# Altium project DIO_8SMA_8MCX.PrjPCB (part 3 of 4)

## Sheet DIOT_SMA_BASE_Split.schdoc: =DocumentName
size A3; EDA_Number: DIOT; Projet: KASLI 3U subsystem; ModifiedBy: -; CreateDate: XX/XX/XXXX; CheckedDate: -; Title2: v1.0; DivGrp: ISE; Designer: A.B.; DocumentNumber: 1; Revision: 0; SheetNumber: 15; SheetTotal: 17
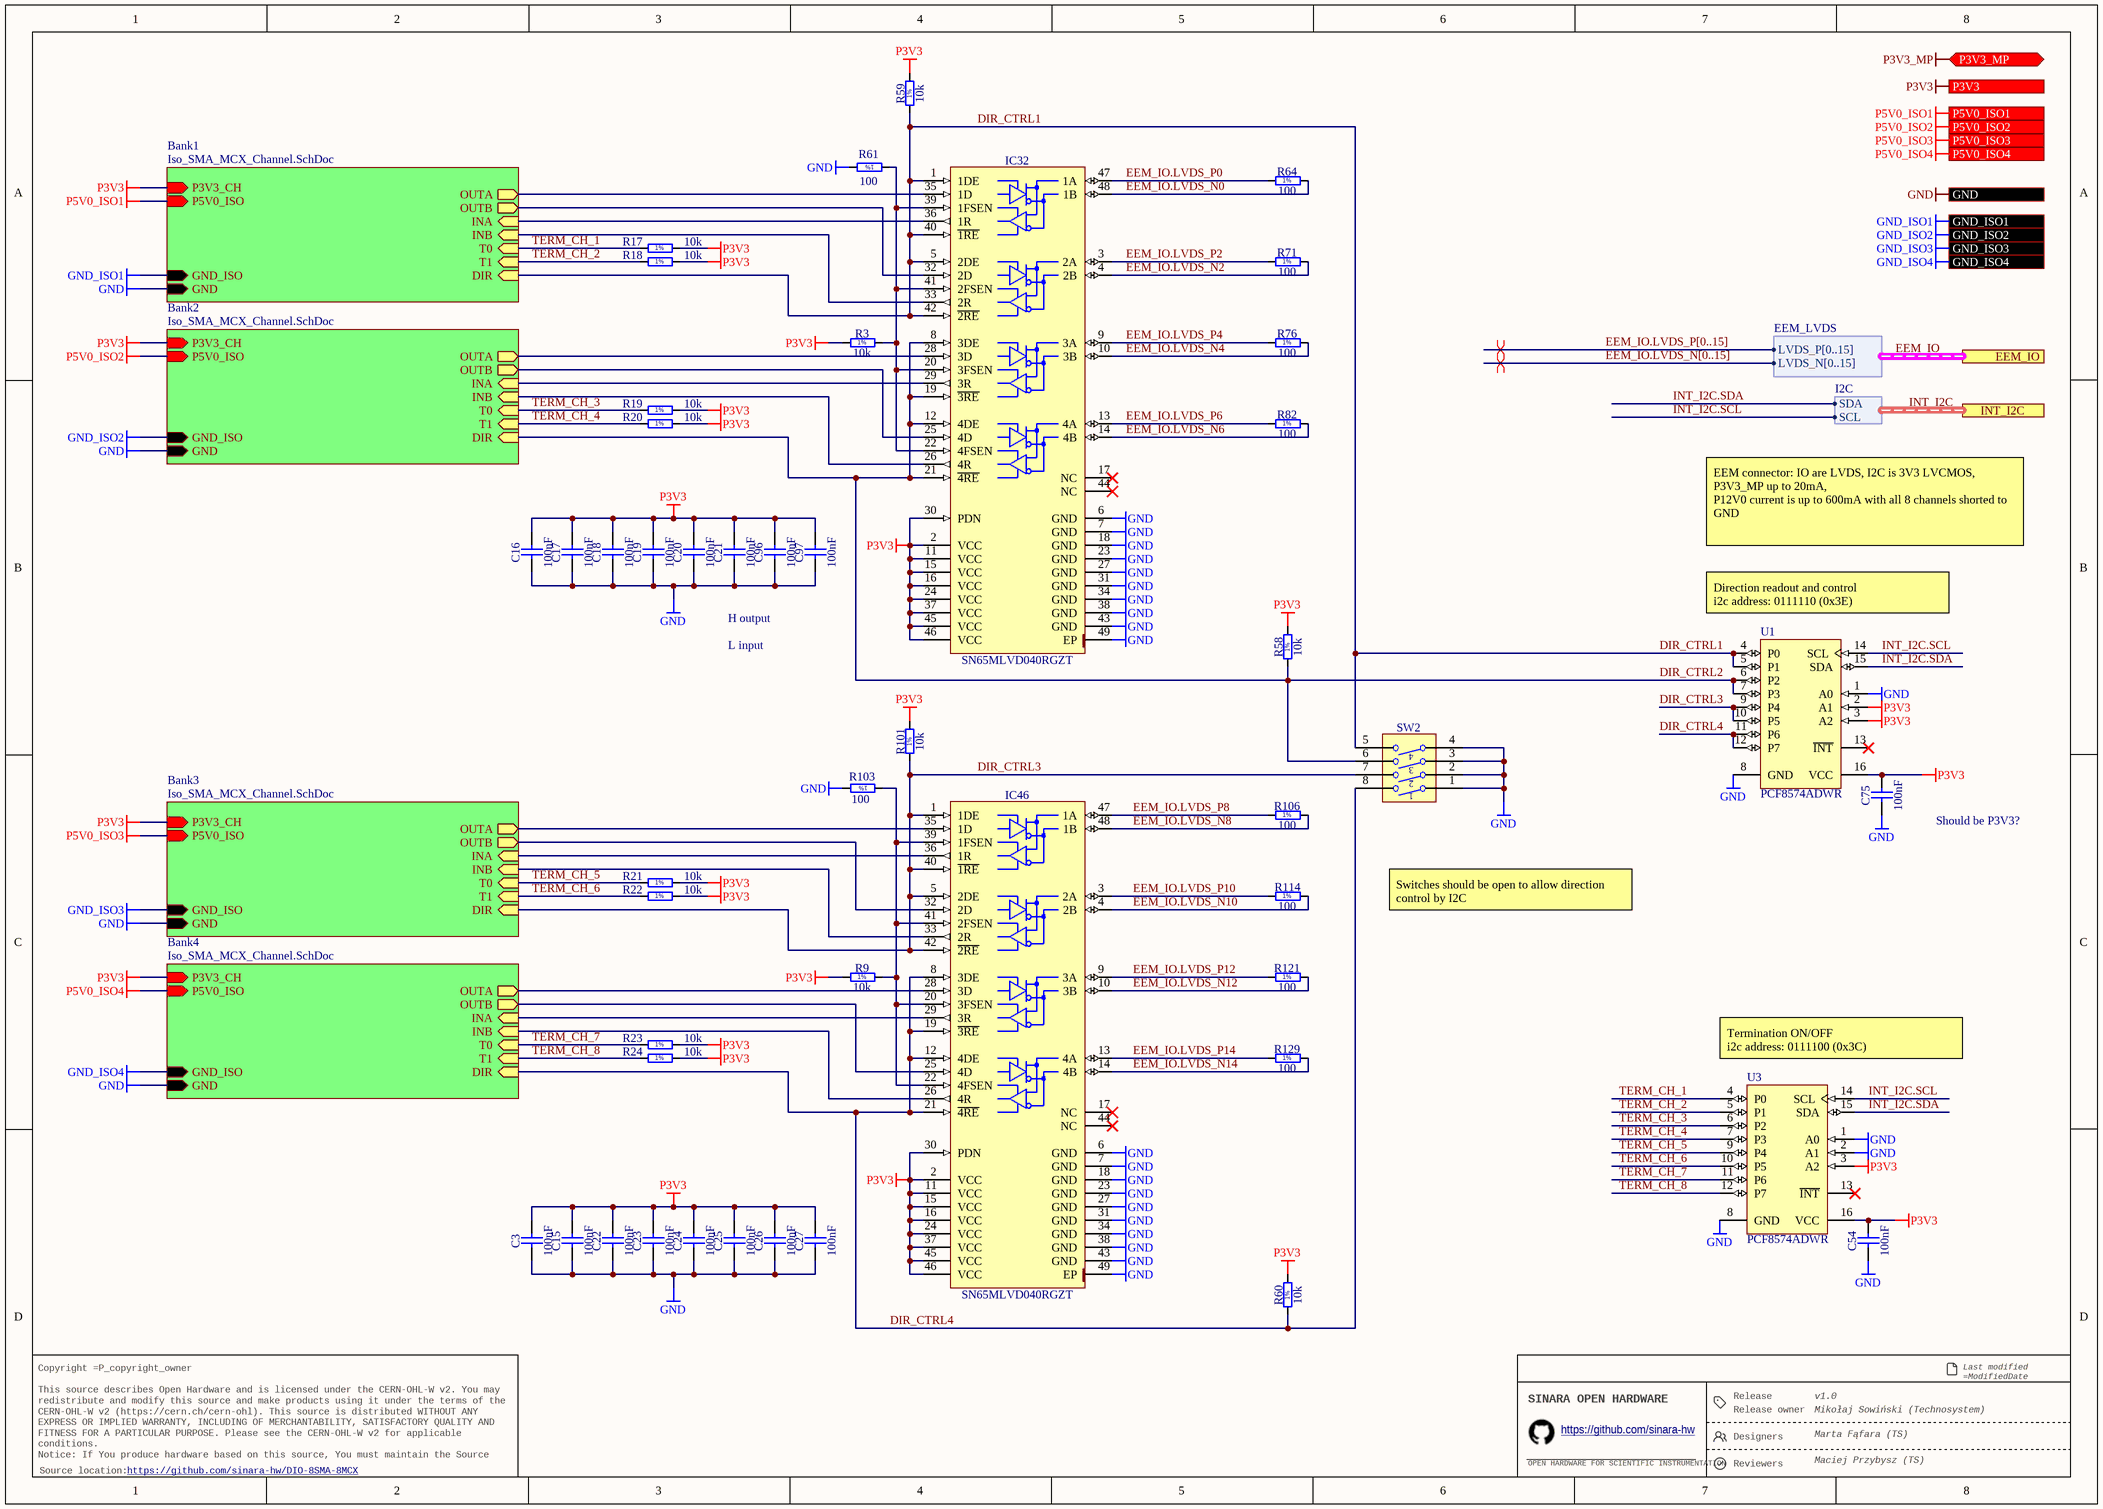
[diagram p14: DIOT_SMA_BASE_Split.schdoc]

### Parts
C3  100nF  [CAPC1005X55N]
C15  100nF  [CAPC1005X55N]
C16  100nF  [CAPC1005X55N]
C17  100nF  [CAPC1005X55N]
C18  100nF  [CAPC1005X55N]
C19  100nF  [CAPC1005X55N]
C20  100nF  [CAPC1005X55N]
C21  100nF  [CAPC1005X55N]
C22  100nF  [CAPC1005X55N]
C23  100nF  [CAPC1005X55N]
C24  100nF  [CAPC1005X55N]
C25  100nF  [CAPC1005X55N]
C26  100nF  [CAPC1005X55N]
C27  100nF  [CAPC1005X55N]
C54  100nF  [CAPC1005X55N]
C75  100nF  [CAPC1005X55N]
C96  100nF  [CAPC1005X55N]
C97  100nF  [CAPC1005X55N]
IC32  SN65MLVD040RGZT  [QFN50P700X700X100-49N-S420]
IC46  SN65MLVD040RGZT  [QFN50P700X700X100-49N-S420]
R3  10k  [RESC1005X40N]
R9  10k  [RESC1005X40N]
R17  10k  [RESC1005X40N]
R18  10k  [RESC1005X40N]
R19  10k  [RESC1005X40N]
R20  10k  [RESC1005X40N]
R21  10k  [RESC1005X40N]
R22  10k  [RESC1005X40N]
R23  10k  [RESC1005X40N]
R24  10k  [RESC1005X40N]
R58  10k  [RESC1005X40N]
R59  10k  [RESC1005X40N]
R60  10k  [RESC1005X40N]
R61  100  [RESC1005X40N]
R64  100  [RESC1005X40N]
R71  100  [RESC1005X40N]
R76  100  [RESC1005X40N]
R82  100  [RESC1005X40N]
R101  10k  [RESC1005X40N]
R103  100  [RESC1005X40N]
R106  100  [RESC1005X40N]
R114  100  [RESC1005X40N]
R121  100  [RESC1005X40N]
R129  100  [RESC1005X40N]
SW2  Switch  [SW_OMRON_A6S-4102-H]  (value not drawn)
U1  PCF8574ADWR  [DW0016A_M]
U3  PCF8574ADWR  [DW0016A_M]

### Sub-sheets
Bank1 = Iso_SMA_MCX_Channel.SchDoc: OUTA (out), OUTB (out), INA (in), INB (in), DIR (in), P3V3_CH (in), P5V0_ISO (in), GND_ISO (in), GND (in), T1 (in), T0 (in)
Bank2 = Iso_SMA_MCX_Channel.SchDoc: OUTA (out), OUTB (out), INA (in), INB (in), DIR (in), P3V3_CH (in), P5V0_ISO (in), GND_ISO (in), GND (in), T1 (in), T0 (in)
Bank3 = Iso_SMA_MCX_Channel.SchDoc: OUTA (out), OUTB (out), INA (in), INB (in), DIR (in), P3V3_CH (in), P5V0_ISO (in), GND_ISO (in), GND (in), T0 (in), T1 (in)
Bank4 = Iso_SMA_MCX_Channel.SchDoc: OUTA (out), OUTB (out), INA (in), INB (in), DIR (in), P3V3_CH (in), P5V0_ISO (in), GND_ISO (in), GND (in), T1 (in), T0 (in)

### Ports
EEM_IO (harness EEM_LVDS), GND, GND_ISO1, GND_ISO2, GND_ISO3, GND_ISO4, INT_I2C (harness I2C), P3V3 (out), P3V3_MP (bidir), P5V0_ISO1 (out), P5V0_ISO2 (out), P5V0_ISO3 (out), P5V0_ISO4 (out)

### Harnesses
I2C: SDA, SCL
EEM_LVDS: LVDS_P[0..15], LVDS_N[0..15]

### Nets
GND: C3.1 C15.1 C16.1 C17.1 C18.1 C19.1 C20.1 C21.1 C22.1 C23.1 C24.1 C25.1 C26.1 C27.1 C54.1 C75.1 C96.1 C97.1 IC32.6(GND) IC32.7(GND) IC32.18(GND) IC32.23(GND) IC32.27(GND) IC32.31(GND) IC32.34(GND) IC32.38(GND) IC32.43(GND) IC32.49(EP) IC46.6(GND) IC46.7(GND) IC46.18(GND) IC46.23(GND) IC46.27(GND) IC46.31(GND) IC46.34(GND) IC46.38(GND) IC46.43(GND) IC46.49(EP) R61.2 R103.2 SW2.1 SW2.2 SW2.3 SW2.4 U1.1(A0) U1.8(GND) U3.1(A0) U3.2(A1) U3.8(GND) ; port GND, sheet Bank1/GND, sheet Bank2/GND, sheet Bank3/GND, sheet Bank4/GND
GND_ISO1: port GND_ISO1, sheet Bank1/GND_ISO
GND_ISO2: port GND_ISO2, sheet Bank2/GND_ISO
GND_ISO3: port GND_ISO3, sheet Bank3/GND_ISO
GND_ISO4: port GND_ISO4, sheet Bank4/GND_ISO
P3V3: C3.2 C15.2 C16.2 C17.2 C18.2 C19.2 C20.2 C21.2 C22.2 C23.2 C24.2 C25.2 C26.2 C27.2 C54.2 C75.2 C96.2 C97.2 IC32.2(VCC) IC32.11(VCC) IC32.15(VCC) IC32.16(VCC) IC32.24(VCC) IC32.30(PDN) IC32.37(VCC) IC32.45(VCC) IC32.46(VCC) IC46.2(VCC) IC46.11(VCC) IC46.15(VCC) IC46.16(VCC) IC46.24(VCC) IC46.30(PDN) IC46.37(VCC) IC46.45(VCC) IC46.46(VCC) R3.1 R9.1 R17.2 R18.2 R19.2 R20.2 R21.2 R22.2 R23.2 R24.2 R58.2 R59.2 R60.2 R101.2 U1.2(A1) U1.3(A2) U1.16(VCC) U3.3(A2) U3.16(VCC) ; port P3V3, sheet Bank1/P3V3_CH, sheet Bank2/P3V3_CH, sheet Bank3/P3V3_CH, sheet Bank4/P3V3_CH
P5V0_ISO1: port P5V0_ISO1, sheet Bank1/P5V0_ISO
P5V0_ISO2: port P5V0_ISO2, sheet Bank2/P5V0_ISO
P5V0_ISO3: port P5V0_ISO3, sheet Bank3/P5V0_ISO
P5V0_ISO4: port P5V0_ISO4, sheet Bank4/P5V0_ISO
DIR_CTRL1: IC32.1(1DE) IC32.5(2DE) IC32.40(~{1RE}) IC32.42(~{2RE}) R59.1 SW2.5 U1.4(P0) U1.5(P1) ; sheet Bank1/DIR
DIR_CTRL2: IC32.8(3DE) IC32.12(4DE) IC32.19(~{3RE}) IC32.21(~{4RE}) R58.1 SW2.6 U1.6(P2) U1.7(P3) ; sheet Bank2/DIR
DIR_CTRL3: IC46.1(1DE) IC46.5(2DE) IC46.40(~{1RE}) IC46.42(~{2RE}) R101.1 SW2.7 U1.9(P4) U1.10(P5) ; sheet Bank3/DIR
DIR_CTRL4: IC46.8(3DE) IC46.12(4DE) IC46.19(~{3RE}) IC46.21(~{4RE}) R60.1 SW2.8 U1.11(P6) U1.12(P7) ; sheet Bank4/DIR
EEM_IO.LVDS_N0: IC32.48(1B) R64.2
EEM_IO.LVDS_N2: IC32.4(2B) R71.2
EEM_IO.LVDS_N4: IC32.10(3B) R76.2
EEM_IO.LVDS_N6: IC32.14(4B) R82.2
EEM_IO.LVDS_N8: IC46.48(1B) R106.2
EEM_IO.LVDS_N10: IC46.4(2B) R114.2
EEM_IO.LVDS_N12: IC46.10(3B) R121.2
EEM_IO.LVDS_N14: IC46.14(4B) R129.2
EEM_IO.LVDS_P0: IC32.47(1A) R64.1
EEM_IO.LVDS_P2: IC32.3(2A) R71.1
EEM_IO.LVDS_P4: IC32.9(3A) R76.1
EEM_IO.LVDS_P6: IC32.13(4A) R82.1
EEM_IO.LVDS_P8: IC46.47(1A) R106.1
EEM_IO.LVDS_P10: IC46.3(2A) R114.1
EEM_IO.LVDS_P12: IC46.9(3A) R121.1
EEM_IO.LVDS_P14: IC46.13(4A) R129.1
INT_I2C.SCL: U1.14(SCL) U3.14(SCL) ; port INT_I2C.SCL  [project net I2C_A.SCL]
INT_I2C.SDA: U1.15(SDA) U3.15(SDA) ; port INT_I2C.SDA  [project net I2C_A.SDA]
TERM_CH_1: R17.1 U3.4(P0) ; sheet Bank1/T0
TERM_CH_2: R18.1 U3.5(P1) ; sheet Bank1/T1
TERM_CH_3: R19.1 U3.6(P2) ; sheet Bank2/T0
TERM_CH_4: R20.1 U3.7(P3) ; sheet Bank2/T1
TERM_CH_5: R21.1 U3.9(P4) ; sheet Bank3/T0
TERM_CH_6: R22.1 U3.10(P5) ; sheet Bank3/T1
TERM_CH_7: R23.1 U3.11(P6) ; sheet Bank4/T0
TERM_CH_8: R24.1 U3.12(P7) ; sheet Bank4/T1
NetB5A_1: IC32.35(1D) ; sheet Bank1/OUTA
NetB5B_1: IC32.28(3D) ; sheet Bank2/OUTA
NetB5C_1: IC46.35(1D) ; sheet Bank3/OUTA
NetB5D_1: IC46.28(3D) ; sheet Bank4/OUTA
NetB7A_1: IC32.32(2D) ; sheet Bank1/OUTB
NetB7B_1: IC32.25(4D) ; sheet Bank2/OUTB
NetB7C_1: IC46.32(2D) ; sheet Bank3/OUTB
NetB7D_1: IC46.25(4D) ; sheet Bank4/OUTB
NetB8A_1: IC32.36(1R) ; sheet Bank1/INA
NetB8B_1: IC32.29(3R) ; sheet Bank2/INA
NetB8C_1: IC46.36(1R) ; sheet Bank3/INA
NetB8D_1: IC46.29(3R) ; sheet Bank4/INA
NetB9A_1: IC32.33(2R) ; sheet Bank1/INB
NetB9B_1: IC32.26(4R) ; sheet Bank2/INB
NetB9C_1: IC46.33(2R) ; sheet Bank3/INB
NetB9D_1: IC46.26(4R) ; sheet Bank4/INB
NetIC32_20: IC32.20(3FSEN) IC32.22(4FSEN) IC32.39(1FSEN) IC32.41(2FSEN) R3.2 R61.1
NetIC46_20: IC46.20(3FSEN) IC46.22(4FSEN) IC46.39(1FSEN) IC46.41(2FSEN) R9.2 R103.1

Not connected (* = marked no-connect by the designer): IC32 17(NC)* 44(NC)*; IC46 17(NC)* 44(NC)*; U1 13(~{INT})*; U3 13(~{INT})*

### Buses and harness runs
bus EEM_IO.LVDS_N[0..15]
bus EEM_IO.LVDS_P[0..15]
harness EEM_IO = port EEM_IO
harness INT_I2C = port INT_I2C

### Layout directives
differential pair; differential pair class Diff_100Ohm: (no net found under the mark)

### Notes on the sheet
- EEM connector: IO are LVDS, I2C is 3V3 LVCMOS, P3V3_MP up to 20mA,
  P12V0 current is up to 600mA with all 8 channels shorted to GND
- H output
- L input
- (near U1) Direction readout and control
  i2c address: 0111110 (0x3E)
- Should be P3V3?
- Switches should be open to allow direction control by I2C
- (near U3) Termination ON/OFF
  i2c address: 0111100 (0x3C)
- Release
- Last modified =ModifiedDate
  Sheet =sheetnumber of =sheettotal · Size A3
- Copyright =P_copyright_owner
  This source describes Open Hardware and is licensed under the CERN-OHL-W v2. You may redistribute and modify this source and make products using it under the terms of the CERN-OHL-W v2 (https://cern.ch/cern-ohl). This source is distributed WITHOUT ANY EXPRESS OR IMPLIED WARRANTY, INCLUDING OF MERCHANTABILITY, SATISFACTORY QUALITY AND FITNESS FOR A PARTICULAR PURPOSE. Please see the CERN-OHL-W v2 for applicable conditions.
  Notice: If You produce hardware based on this source, You must maintain the Source Location visible on the product, its packaging or its documentation.
- SINARA OPEN HARDWARE
- OPEN HARDWARE FOR SCIENTIFIC INSTRUMENTATION
- https://github.com/sinara-hw
- Release owner
- Designers
- Reviewers
- Source location:
- (in symbol R0402_10K_1%_0.0625W_100PPM) 1%
- (in symbol R0402_100R_1%_0.1W_100PPM) 1%

### Library data of the parts
C3 C15-C27 C54 C75 C96 C97 = CC0402_100NF_50V_10%_X7R: Non-polarised capacitor; Part Description: SMD Multilayer Chip Ceramic Capacitor; Manufacturer: GENERIC; Manufacturer1 Part Number: GRM155R71H104KE14D; Voltage: 50V; TC: X7R; Tolerance: ±10%; Part Number: CC0402_100NF_50V_10%_X7R; Component Kind: Standard; Component Type: Standard; Pin Count: 2; Value: 100nF; Status: None; Manufacturer Part Number: CC0402_100NF_50V_10%_X7R; Case: 0402; Mounted: Yes; Socket: No; SMD: Yes; Sense: No; HelpURL: \\cern.ch\dfs\Applications\Altium\Datasheets\CC0402_MURATA_GRM155R71H104KE14D.pdf; Author: CERN DEM MR; CreateDate: 30.06.2017; LatestRevisionDate: 30.06.2017; Manufacturer1 Example: MURATA; Manufacturer1 ComponentHeight: 0.55mm
IC32 IC46 = SN65MLVD040RGZT: 4-Channel Half-Duplex M-LVDS Line Transceiver; Manufacturer: TEXAS INSTRUMENTS; PressFit: No; Bonding: No; Part Number: SN65MLVD040RGZT; Component Kind: Standard; Component Type: Standard; Device: SN65MLVD040RGZT; PackageDescription: QFN, 0.50mm Pitch, Square; 48 Pin, 7.00mm L X 7.00mm W X 1mm H body (W/Thermal Tab 4.2mm X 4.2mm), IPC Medium Density; Part Description: 4-Channel Half-Duplex M-LVDS Line Transceiver; Manufacturer Part Number: SN65MLVD040RGZT; Pin Count: 49; Case: QFN48; Mounted: Yes; Socket: No; SMD: Yes; Sense: No; ComponentHeight: 1mm; Author: CERN DEM JLC; HelpURL: \\cern.ch\dfs\Applications\Altium\Datasheets\SN65MLVD040RGZT.pdf; CreateDate: 17.03.2011; LatestRevisionDate: 17.03.2011
R3 R9 R17-R24 R58-R60 R101 = R0402_10K_1%_0.0625W_100PPM: Resistor - 1%; Part Description: General Purpose Thick Film Chip Resistor; Manufacturer: GENERIC; Manufacturer1 Part Number: 232270671003L; TC: ±100ppm/°C; Part Number: R0402_10K_1%_0.0625W_100PPM; Component Kind: Standard; Component Type: Standard; Pin Count: 2; Value: 10k; Status: Not recommended; Power: 0.0625W; Tolerance: ±1%; Manufacturer Part Number: R0402_10K_1%_0.0625W_100PPM; Case: 0402; Mounted: Yes; Sense: No; Socket: No; SMD: Yes; Manufacturer1 Example: YAGEO PHYCOMP; Manufacturer1 ComponentHeight: 0.4mm; HelpURL: \\cern.ch\dfs\Applications\Altium\Datasheets\R0402_Phycomp_RC0402.pdf; Author: CERN DEM JLC; CreateDate: 03.12.2007; LatestRevisionDate: 17.10.2012
R61 R64 R71 R76 R82 R103 R106 R114 R121 R129 = R0402_100R_1%_0.1W_100PPM: Resistor - 1%; Part Description: General Purpose Thick Film Chip Resistor; Manufacturer: GENERIC; Manufacturer Part Number: R0402_100R_1%_0.1W_100PPM_50V; Manufacturer1 Part Number: ERJ2RKF1000X; Power: 0.1W; TC: ±100ppm/°C; Voltage: 50V; Part Number: R0402_100R_1%_0.1W_100PPM; Component Kind: Standard; Component Type: Standard; Pin Count: 2; Value: 100; Status: Not recommended; Tolerance: ±1%; Case: 0402; Mounted: Yes; Sense: No; Socket: No; SMD: Yes; Manufacturer1 Example: PANASONIC; Manufacturer1 ComponentHeight: 0.4mm; HelpURL: \\cern.ch\dfs\Applications\Altium\Datasheets\R0402_PANASONIC_ERJ2RK.pdf; Author: CERN DEM JLC; CreateDate: 12.12.2013; LatestRevisionDate: 03.03.2015
SW2 = SW_OMRON_A6S-4102-H: 4 Ways SPST DIP Switch; Part Description: 4 Ways SPST DIP Switch, White Flat Actuator with Seal Tape, Contact Rating 25mA 24VDC; Manufacturer: OMRON; PressFit: No; Part Number: SW_OMRON_A6S-4102-H; Component Kind: Standard; Component Type: Standard; Pin Count: 8; PackageDescription: Pitch 2.54mm, Body 11.3x6.4mm, 4 Ways SPST Surface-Mounting DIP Switch, OMRON A6S-H; Family: Switch; Mounted: Yes; Socket: No; SMD: Yes; Sense: No; Status: None; Manufacturer Part Number: A6S-4102-H; ComponentHeight: 3.8mm; HelpURL: \\cern.ch\dfs\Applications\Altium\Datasheets\SW_OMRON_A6S-4102-H.pdf; Author: CERN DEM JMW; CreateDate: 25.09.2008; LatestRevisionDate: 25.09.2008
U1 U3 = CMP-015-00013-1: 8-bit 2.5- to 5.5-V I2C/SMBus I/O expander with interrupt 16-SOIC -40 to 85; Manufacturer: Texas Instruments; Max Supply Voltage: 6V; Min Supply Voltage: 2.5V; Case/Package: SOIC; Manufacturer Part Number: PCF8574ADWR; Pins: 16; Min Operating Temperature: -40°C; Max Operating Temperature: 85°C

## Sheet Iso_SMA_MCX_Channel.SchDoc: =DocumentName
size A4; Organization: Technosystem; Address1: Słoneczna 125, 05-506 Kolonia Lesznowola; Address2: https://technosystem.pl/; Address4: (NOT USED); DocumentNumber: 8; Revision: 0; SheetNumber: 16; SheetTotal: 17; Version: 1.0
Used 4 times, as channels U_DIOT_SMA_BASE/Bank1, U_DIOT_SMA_BASE/Bank2, U_DIOT_SMA_BASE/Bank3, U_DIOT_SMA_BASE/Bank4. Parts and nets are listed once, with the designators drawn on the sheet.
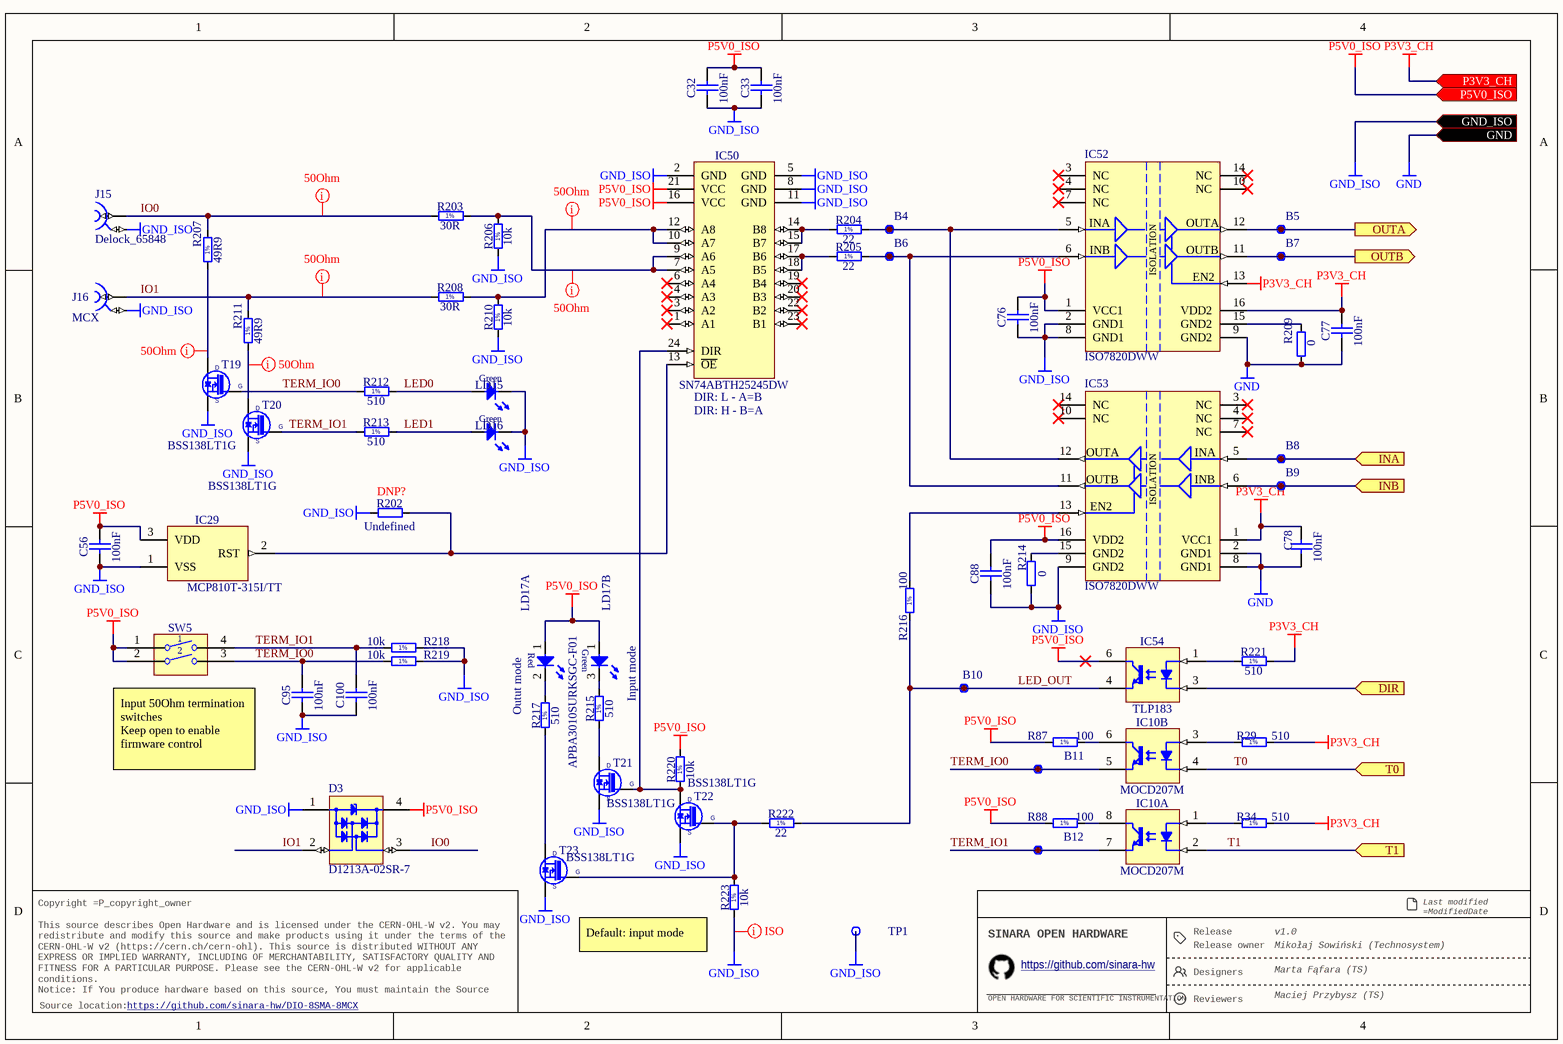
[diagram p15: Iso_SMA_MCX_Channel.SchDoc]

### Parts
B4  SMD Pad  [C100]  (value not drawn)  (no BOM)
B5  SMD Pad  [C100]  (value not drawn)  (no BOM)
B6  SMD Pad  [C100]  (value not drawn)  (no BOM)
B7  SMD Pad  [C100]  (value not drawn)  (no BOM)
B8  SMD Pad  [C100]  (value not drawn)  (no BOM)
B9  SMD Pad  [C100]  (value not drawn)  (no BOM)
B10  SMD Pad  [C100]  (value not drawn)  (no BOM)
B11  SMD Pad  [C100]  (value not drawn)  (no BOM)
B12  SMD Pad  [C100]  (value not drawn)  (no BOM)
C32  100nF  [CAPC1005X55N]
C33  100nF  [CAPC1005X55N]
C56  100nF  [CAPC1005X55N]
C76  100nF  [CAPC1005X55N]
C77  100nF  [CAPC1005X55N]
C78  100nF  [CAPC1005X55N]
C88  100nF  [CAPC1005X55N]
C95  100nF  [CAPC1005X55N]
C100  100nF  [CAPC1005X55N]
D3  D1213A-02SR-7  [SOT190P238X100-4N]
IC10  MOCD207M  [SOIC127P594X363-8N]  (parts A,B of 2)
IC29  MCP810T-315I/TT  [SOT95P237X112-3N]
IC50  SN74ABTH25245DW  [SOIC127P1030X265-24N]
IC52  ISO7820DWW  [SOIC127P1720X265-16N]
IC53  ISO7820DWW  [SOIC127P1720X265-16N]
IC54  TLP183  [TOSHIBA_11-4M1S]
J15  Delock_65848  [Delock_65848]
J16  MCX  [AMPHENOL_919-383J-51A]
LD15  Green  [LED_AVAGO_HSME-C120]
LD16  Green  [LED_AVAGO_HSME-C120]
LD17  APBA3010SURKSGC-F01  [APBA3010SURKSGC-F01]  (parts A,B of 2)
R29  510  [RESC1005X40N]
R34  510  [RESC1005X40N]
R87  100  [RESC1005X40N]
R88  100  [RESC1005X40N]
R202  Undefined  [RESC1005X40N]
R203  30R  [RESC3225X70N]
R204  22  [RESC1005X40N]
R205  22  [RESC1005X40N]
R206  10k  [RESC1005X40N]
R207  49R9  [RESC3225X70N]
R208  30R  [RESC3225X70N]
R209  0  [RESC1005X40N]
R210  10k  [RESC1005X40N]
R211  49R9  [RESC3225X70N]
R212  510  [RESC1005X40N]
R213  510  [RESC1005X40N]
R214  0  [RESC1005X40N]
R215  510  [RESC1005X40N]
R216  100  [RESC1005X40N]
R217  510  [RESC1005X40N]
R218  10k  [RESC1005X40N]
R219  10k  [RESC1005X40N]
R220  10k  [RESC1005X40N]
R221  510  [RESC1005X40N]
R222  22  [RESC1005X40N]
R223  10k  [RESC1005X40N]
SW5  Switch  [SW_OMRON_A6S-2102-H]  (value not drawn)
T19  BSS138LT1G  [SOT95P240X110-3N]
T20  BSS138LT1G  [SOT95P240X110-3N]
T21  BSS138LT1G  [SOT95P240X110-3N]
T22  BSS138LT1G  [SOT95P240X110-3N]
T23  BSS138LT1G  [SOT95P240X110-3N]
TP1  Plated Hole  [c150h100]  (value not drawn)  (no BOM)

### Ports
DIR (in), GND (in), GND_ISO (in), INA (in), INB (in), OUTA (out), OUTB (out), P3V3_CH (in), P5V0_ISO (in), T0 (in), T1 (in)

### Nets
GND: C77.1 C78.1 IC52.9(GND2) IC53.2(GND1) IC53.8(GND1) R209.2 ; port GND
GND_ISO: C32.1 C33.1 C56.1 C76.1 C88.1 C95.1 C100.1 D3.1(GND) IC29.1(VSS) IC50.2(GND) IC50.5(GND) IC50.8(GND) IC50.11(GND) IC52.2(GND1) IC52.8(GND1) IC53.9(GND2) J15.2 J16.2 LD15.1(C) LD16.1(C) R202.1 R206.1 R210.1 R214.1 R218.2 R219.2 R223.1 T19.2(S) T20.2(S) T21.2(S) T22.2(S) T23.2(S) TP1.1 ; port GND_ISO
P3V3_CH: C77.2 C78.2 IC52.13(EN2) IC52.16(VDD2) IC53.1(VCC1) R29.2 R34.2 R221.2 ; port P3V3_CH
P5V0_ISO: C32.2 C33.2 C56.2 C76.2 C88.2 D3.4(VCC) IC29.3(VDD) IC50.16(VCC) IC50.21(VCC) IC52.1(VCC1) IC53.16(VDD2) IC54.6(C) LD17.1(A) R87.1 R88.1 R220.2 SW5.1 SW5.2 ; port P5V0_ISO
DIR: IC54.3(C) ; port DIR
INA: B8.1 IC53.5(INA) ; port INA
INB: B9.1 IC53.6(INB) ; port INB
IO0: D3.3(I/O2) J15.1 R203.1 R207.2
IO1: D3.2(I/O1) J16.1 R208.1 R211.2
LED0: LD15.2(A) R212.2
LED1: LD16.2(A) R213.2
LED_OUT: B10.1 IC54.4(E) R216.1 R222.2
OUTA: B5.1 IC52.12(OUTA) ; port OUTA
OUTB: B7.1 IC52.11(OUTB) ; port OUTB
T0: IC10.4(K) ; port T0
T1: IC10.2(K) ; port T1
TERM_IO0: B11.1 C95.2 IC10.5(E) R212.1 R219.1 SW5.3 T19.1(G)
TERM_IO1: B12.1 C100.2 IC10.7(E) R213.1 R218.1 SW5.4 T20.1(G)
NetB4_1: B4.1 IC52.5(INA) IC53.12(OUTA) R204.2
NetB6_1: B6.1 IC52.6(INB) IC53.11(OUTB) R205.2
NetIC10_1: IC10.1(A) R34.1
NetIC10_3: IC10.3(A) R29.1
NetIC10_6: IC10.6(C) R87.2
NetIC10_8: IC10.8(C) R88.2
NetIC29_2: IC29.2(RST) IC50.13(~{OE}) R202.2
NetIC50_7: IC50.7(A5) IC50.9(A6) R203.2 R206.2
NetIC50_10: IC50.10(A7) IC50.12(A8) R208.2 R210.2
NetIC50_14: IC50.14(B8) IC50.15(B7) R204.1
NetIC50_17: IC50.17(B6) IC50.18(B5) R205.1
NetIC50_24: IC50.24(DIR) R220.1 T21.1(G) T22.3(D)
NetIC52_15: IC52.15(GND2) R209.1
NetIC53_13: IC53.13(EN2) R216.2
NetIC53_15: IC53.15(GND2) R214.2
NetIC54_1: IC54.1(A) R221.1
NetLD17_2: LD17.2(C) R217.2
NetLD17_3: LD17.3(C) R215.2
NetR207_1: R207.1 T19.3(D)
NetR211_1: R211.1 T20.3(D)
NetR215_1: R215.1 T21.3(D)
NetR217_1: R217.1 T23.3(D)
NetR222_1: R222.1 R223.2 T22.1(G) T23.1(G)

Not connected (* = marked no-connect by the designer): IC50 1(A1)* 3(A2)* 4(A3)* 6(A4)* 19(B4)* 20(B3)* 22(B2)* 23(B1)*; IC52 3(NC)* 4(NC)* 7(NC)* 10(NC)* 14(NC)*; IC53 3(NC)* 4(NC)* 7(NC)* 10(NC)* 14(NC)*

### Channels
U_DIOT_SMA_BASE/Bank1: designators end in A; ports DIR=DIR_CTRL1 GND=GND GND_ISO=GND_ISO1 INA=NetB8A_1 INB=NetB9A_1 OUTA=NetB5A_1 OUTB=NetB7A_1 P3V3_CH=P3V3 P5V0_ISO=P5V0_ISO1 T0=TERM_CH_1 T1=TERM_CH_2
U_DIOT_SMA_BASE/Bank2: designators end in B; ports DIR=DIR_CTRL2 GND=GND GND_ISO=GND_ISO2 INA=NetB8B_1 INB=NetB9B_1 OUTA=NetB5B_1 OUTB=NetB7B_1 P3V3_CH=P3V3 P5V0_ISO=P5V0_ISO2 T0=TERM_CH_3 T1=TERM_CH_4
U_DIOT_SMA_BASE/Bank3: designators end in C; ports DIR=DIR_CTRL3 GND=GND GND_ISO=GND_ISO3 INA=NetB8C_1 INB=NetB9C_1 OUTA=NetB5C_1 OUTB=NetB7C_1 P3V3_CH=P3V3 P5V0_ISO=P5V0_ISO3 T0=TERM_CH_5 T1=TERM_CH_6
U_DIOT_SMA_BASE/Bank4: designators end in D; ports DIR=DIR_CTRL4 GND=GND GND_ISO=GND_ISO4 INA=NetB8D_1 INB=NetB9D_1 OUTA=NetB5D_1 OUTB=NetB7D_1 P3V3_CH=P3V3 P5V0_ISO=P5V0_ISO4 T0=TERM_CH_7 T1=TERM_CH_8

### Layout directives
net class GND_ISO: GND_ISO1
net class 50Ohm: IO0_Bank1, IO1_Bank1, NetIC50A_7, NetIC50A_10, NetR207A_1, NetR211A_1

### Notes on the sheet
- (near IC50) DIR: L - A=B
- (near IC50) DIR: H - B=A
- (near R202) DNP?
- Outut mode
- Input mode
- (near SW5) Input 50Ohm termination switches
  Keep open to enable firmware control
- Default: input mode
- Release
- Last modified =ModifiedDate
  Sheet =sheetnumber of =sheettotal · Size A4
- Copyright =P_copyright_owner
  This source describes Open Hardware and is licensed under the CERN-OHL-W v2. You may redistribute and modify this source and make products using it under the terms of the CERN-OHL-W v2 (https://cern.ch/cern-ohl). This source is distributed WITHOUT ANY EXPRESS OR IMPLIED WARRANTY, INCLUDING OF MERCHANTABILITY, SATISFACTORY QUALITY AND FITNESS FOR A PARTICULAR PURPOSE. Please see the CERN-OHL-W v2 for applicable conditions.
  Notice: If You produce hardware based on this source, You must maintain the Source Location visible on the product, its packaging or its documentation.
- SINARA OPEN HARDWARE
- OPEN HARDWARE FOR SCIENTIFIC INSTRUMENTATION
- https://github.com/sinara-hw
- Release owner
- Designers
- Reviewers
- Source location:
- (in symbol CMP-007-00060-1, part A) Red
- (in symbol CMP-007-00060-1, part B) Green
- (in symbol CMP-015-00012-2) ISOLATION
- (in symbol R0402_10K_1%_0.0625W_100PPM) 1%
- (in symbol R0402_22R_1%_0.0625W_100PPM) 1%
- (in symbol R0402_100R_1%_0.1W_100PPM) 1%
- (in symbol R0402_510R_1%_0.0625W_100PPM) 1%
- (in symbol R1210_30R_5%_0.5W_200PPM) 1%
- (in symbol R1210_49R9_1%_0.5W_100PPM_VISHAY_CRCW) 1%

### Library data of the parts
B4-B12 = SMD_PAD_D1MM: Through Hole Pad; Part Description: 1mm Diameter SMD Pad; Mounted: No; Part Number: SMD_PAD_D1MM; Component Type: Standard (No BOM); Pin Count: 1; Family: SMD Pad; Socket: No; SMD: No; Sense: No; Status: None; ComponentHeight: 0mm; HelpURL: Undefined; Author: CERN DEM JLC; CreateDate: 10.10.2017; LatestRevisionDate: 10.10.2017; PackageDescription: 1mm Diameter SMD Pad
C32 C33 C56 C76-C78 C88 C95 C100 = CC0402_100NF_50V_10%_X7R: as C3 on sheet DIOT_SMA_BASE_Split; Part Number: CC0402_100NF_50V_10%_X7R; Component Kind: Standard; Component Type: Standard; Pin Count: 2; Value: 100nF; Status: None; Manufacturer Part Number: CC0402_100NF_50V_10%_X7R; Case: 0402; Mounted: Yes; Socket: No; SMD: Yes; Sense: No; HelpURL: \\cern.ch\dfs\Applications\Altium\Datasheets\CC0402_MURATA_GRM155R71H104KE14D.pdf; Author: CERN DEM MR; CreateDate: 30.06.2017; LatestRevisionDate: 30.06.2017; Manufacturer1 Example: MURATA; Manufacturer1 ComponentHeight: 0.55mm
D3 = CMP-004-00039-1: D1213A-02SR Series 400 mW Uni-Directional Surface Mount TVS Diode - SOT-143; Mounting Technology: Surface Mount; Case/Package: SOT-143; Max Operating Temperature: 150°C; Pins: 4; Min Operating Temperature: -65°C
IC10 = MOCD207M: Dual Optocoupler; Part Description: Dual-Channel Phototransistor Output Optocoupler; Manufacturer: ON SEMICONDUCTOR; PressFit: No; Bonding: No; Part Number: MOCD207M; Component Kind: Standard; Component Type: Standard; Device: MOCD207M; PackageDescription: SOIC, 1.27mm Pitch; 8 Pin, 3.91mm W X 4.88mm L, IPC Medium Density; Manufacturer Part Number: MOCD207M; Pin Count: 8; Case: SOIC8; Mounted: Yes; Socket: No; SMD: Yes; Sense: No; ComponentHeight: 3.63mm; HelpURL: \\cern.ch\dfs\Applications\Altium\Datasheets\MOCD207M.pdf; Author: CERN DEM JLC; CreateDate: 03.10.2017; LatestRevisionDate: 03.10.2017
IC29 = VMON_MCP810: 3.075V Microcontroller Supervisory Circuit With Push-Pull Output; Manufacturer: MICROCHIP TECHNOLOGY; PressFit: No; Bonding: No; Part Number: MCP810T-315I/TT; Component Kind: Standard; Component Type: Standard; Device: MCP810T-315I/TT; PackageDescription: SOT, 0.95mm, pitch; 3 pin,1.30mm W X 2.92mm L X 1.12mm H body, IPC Medium Density; Part Description: 3.075V Microcontroller Supervisory Circuit With Push-Pull Output; Manufacturer Part Number: MCP810T-315I/TT; Pin Count: 3; Case: SOT23; Mounted: Yes; Socket: No; SMD: Yes; Sense: No; ComponentHeight: 1.12mm; Author: GK; HelpURL: \\cern.ch\dfs\Applications\Altium\Datasheets\MCP809T-315I-TT.pdf; CreateDate: 16.06.2011; LatestRevisionDate: 16.06.2011
IC50 = SN74ABTH25245DW: 25 Ohms Octal Bus Transceiver With 3-State Outputs; Manufacturer: TEXAS INSTRUMENTS; PressFit: No; Bonding: No; Part Number: SN74ABTH25245DW; Component Kind: Standard; Component Type: Standard; Device: SN74ABTH25245DW; PackageDescription: SOIC 24, Pitch 1.27mm - Body 7.6x15.6mm, IPC Medium Density; Part Description: 25 Ohms Octal Bus Transceiver with 3-State Outputs; Manufacturer Part Number: SN74ABTH25245DW; Pin Count: 24; Case: SOIC24; Mounted: Yes; Socket: No; SMD: Yes; Sense: No; ComponentHeight: 2.65mm; Author: CERN DEM JLC; HelpURL: \\cern.ch\dfs\Applications\Altium\Datasheets\SN74ABTH25245DW.pdf; CreateDate: 03.04.2017; LatestRevisionDate: 03.04.2017
IC52 IC53 = CMP-015-00012-2: Highest isolation rating, dual-channel, 2/0, reinforced digital isolator 16-SOIC -55 to 125; Manufacturer: Texas Instruments; Max Supply Voltage: 5.5V; Min Supply Voltage: 2.25V; Manufacturer Part Number: ISO7820DWW; Pins: 16; Min Operating Temperature: -55°C; Case/Package: SOIC; Max Operating Temperature: 125°C
IC54 = TLP183: Single Optocoupler; Part Description: Photocoupler InGaAs Infrared LED & Photo-Transistor; Manufacturer: TOSHIBA; PressFit: No; Bonding: No; Part Number: TLP183; Component Kind: Standard; Component Type: Standard; Device: TLP183; PackageDescription: SOIC, 1.27mm Pitch; 4 Pin, TOSHIBA Case (5mm Creepage); Manufacturer Part Number: TLP183; Pin Count: 4; Case: SOIC4; Mounted: Yes; Socket: No; SMD: Yes; Sense: No; ComponentHeight: 2.3mm; HelpURL: \\cern.ch\dfs\Applications\Altium\Datasheets\TLP183.pdf; Author: CERN DEM JMW; CreateDate: 05.10.2015; LatestRevisionDate: 04.09.2017
J15 = CMP-002-04652-5: SMA connector Delock 65848
J16 = AMPHENOL_919-383J-51A: Part Description: 50 Ohm, RF Connector, MCX Right Angle PCB Receptacle Jack; PressFit: No; Part Number: AMPHENOL_919-383J-51A; Component Kind: Standard; Component Type: Standard; Pin Count: 5; Family: MCX; Mounted: Yes; Socket: No; SMD: No; Sense: No; Status: None; Manufacturer: AMPHENOL; Manufacturer Part Number: 919-383J-51A; ComponentHeight: 6mm; HelpURL: \\cern.ch\dfs\Applications\Altium\Datasheets\AMPHENOL_919-383J-51A.pdf; Author: CERN DEM BC; CreateDate: 31.01.2019; LatestRevisionDate: 31.01.2019
LD15 LD16 = LED_AVAGO_HSME-C120: LED Green 1C 2A; Part Description: High Performance Right Angle Chip Green LED; Manufacturer: AVAGO TECHNOLOGIES; PressFit: No; Bonding: No; Manufacturer Part Number: HSME-C120; ComponentHeight: 0.7mm; HelpURL: \\cern.ch\dfs\Applications\Altium\Datasheets\LED_AVAGO_HSME-C120.pdf; Part Number: LED_AVAGO_HSME-C120; Component Kind: Standard; Component Type: Standard; Color: Green; PackageDescription: Green Chip LED, 2-Leads, Body 1.7x1.1mm, Side Emitting Package; Pin Count: 2; Mounted: Yes; Socket: No; SMD: Yes; Sense: No; Author: CERN DEM JMW; CreateDate: 22.07.2009; LatestRevisionDate: 20.06.2012; ComponentLink1URL: \\cern.ch\dfs\Applications\Altium\Datasheets\LED_AVAGO_HSME-C110_DESIGN-GUIDE.pdf; ComponentLink1Description: Design Guide
LD17 = CMP-007-00060-1: Dual Color LED, Hyper Red/super Bright Green, Water Clear, 2mm; Manufacturer: Kingbright; Forward Voltage: 2.2V; Manufacturer Part Number: APBA3010SURKSGC-F01; Mounting Technology: Surface Mount; Max Operating Temperature: 85°C; Min Operating Temperature: -40°C; Case/Package: SMD/SMT
R29 R34 R212 R213 R215 R217 R221 = R0402_510R_1%_0.0625W_100PPM: Resistor - 1%; Part Description: General Purpose Thick Film Chip Resistor; Manufacturer: GENERIC; Manufacturer1 Part Number: 232270675101L; TC: ±100ppm/°C; Part Number: R0402_510R_1%_0.0625W_100PPM; Component Kind: Standard; Component Type: Standard; Pin Count: 2; Value: 510; Status: Not recommended; Power: 0.0625W; Tolerance: ±1%; Manufacturer Part Number: R0402_510R_1%_0.0625W_100PPM; Case: 0402; Mounted: Yes; Sense: No; Socket: No; SMD: Yes; Manufacturer1 Example: YAGEO PHYCOMP; Manufacturer1 ComponentHeight: 0.4mm; HelpURL: \\cern.ch\dfs\Applications\Altium\Datasheets\R0402_Phycomp_RC0402.pdf; Author: CERN DEM JLC; CreateDate: 03.12.2007; LatestRevisionDate: 17.10.2012
R87 R88 R216 = R0402_100R_1%_0.1W_100PPM: as R61 on sheet DIOT_SMA_BASE_Split; Part Number: R0402_100R_1%_0.1W_100PPM; Component Kind: Standard; Component Type: Standard; Pin Count: 2; Value: 100; Status: Not recommended; Tolerance: ±1%; Case: 0402; Mounted: Yes; Sense: No; Socket: No; SMD: Yes; Manufacturer1 Example: PANASONIC; Manufacturer1 ComponentHeight: 0.4mm; HelpURL: \\cern.ch\dfs\Applications\Altium\Datasheets\R0402_PANASONIC_ERJ2RK.pdf; Author: CERN DEM JLC; CreateDate: 12.12.2013; LatestRevisionDate: 03.03.2015
R202 = R0402_NO-VALUE: Resistor; Part Description: Reserved Footprint For a 0402 (1005) Chip Resistor; PressFit: No; Mounted: No; Part Number: R0402_NO-VALUE; Component Kind: Standard; Component Type: Standard; Pin Count: 2; Value: Undefined; Status: None; Manufacturer: Undefined; Manufacturer Part Number: R0402_NO-VALUE; Case: 0402; Sense: No; Socket: No; SMD: Yes; Manufacturer1 Example: Undefined; Manufacturer1 Part Number: Undefined; Manufacturer1 ComponentHeight: Undefined; HelpURL: Undefined; Author: CERN DEM JLC; CreateDate: 03.12.2007; LatestRevisionDate: 13.03.2008
R203 R208 = R1210_30R_5%_0.5W_200PPM: Resistor - 5%; Part Description: Thick Film Chip Resistor; Manufacturer: VISHAY; Manufacturer Part Number: CRCW121030R0JNEA; Power: 0.5W; TC: ±200ppm/°C; PressFit: No; Part Number: R1210_30R_5%_0.5W_200ppm; Component Kind: Standard; Component Type: Standard; Pin Count: 2; Value: 30R; Status: None; Tolerance: ±5%; Case: 1210; Mounted: Yes; Sense: No; Socket: No; SMD: Yes; HelpURL: \\cern.ch\dfs\Applications\Altium\Datasheets\R1210_VISHAY_CRCW1210.pdf; Author: CERN DEM JMW; CreateDate: 06.08.2014; LatestRevisionDate: 06.08.2014; ComponentHeight: 0.6mm
R204 R205 R222 = R0402_22R_1%_0.0625W_100PPM: Resistor - 1%; Part Description: General Purpose Thick Film Chip Resistor; Manufacturer: GENERIC; Manufacturer1 Part Number: 232270672209L; TC: ±100ppm/°C; PressFit: No; Part Number: R0402_22R_1%_0.0625W_100PPM; Component Kind: Standard; Component Type: Standard; Pin Count: 2; Value: 22; Status: Not Recommended; Power: 0.0625W; Tolerance: ±1%; Manufacturer Part Number: R0402_22R_1%_0.0625W_100PPM; Case: 0402; Mounted: Yes; Sense: No; Socket: No; SMD: Yes; Manufacturer1 Example: YAGEO PHYCOMP; Manufacturer1 ComponentHeight: 0.4mm; HelpURL: \\cern.ch\dfs\Applications\Altium\Datasheets\R0402_Phycomp_RC0402.pdf; Author: CERN DEM JLC; CreateDate: 03.12.2007; LatestRevisionDate: 17.10.2012
R206 R210 R218-R220 R223 = R0402_10K_1%_0.0625W_100PPM: as R3 on sheet DIOT_SMA_BASE_Split; Part Number: R0402_10K_1%_0.0625W_100PPM; Component Kind: Standard; Component Type: Standard; Pin Count: 2; Value: 10k; Status: Not recommended; Power: 0.0625W; Tolerance: ±1%; Manufacturer Part Number: R0402_10K_1%_0.0625W_100PPM; Case: 0402; Mounted: Yes; Sense: No; Socket: No; SMD: Yes; Manufacturer1 Example: YAGEO PHYCOMP; Manufacturer1 ComponentHeight: 0.4mm; HelpURL: \\cern.ch\dfs\Applications\Altium\Datasheets\R0402_Phycomp_RC0402.pdf; Author: CERN DEM JLC; CreateDate: 03.12.2007; LatestRevisionDate: 17.10.2012
R207 R211 = R1210_49R9_1%_0.5W_100PPM_VISHAY_CRCW: Resistor - 1%; Part Description: Thick Film Chip Resistor; Manufacturer: VISHAY DRALORIC; Manufacturer Part Number: CRCW121049R9FKTA; Power: 0.5W; TC: ±100ppm/°C; Part Number: R1210_49R9_1%_0.5W_100PPM_VISHAY_CRCW; Component Kind: Standard; Component Type: Standard; Pin Count: 2; Value: 49R9; Status: None; Tolerance: ±1%; Case: 1210; Mounted: Yes; Sense: No; Socket: No; SMD: Yes; ComponentHeight: 0.6mm; HelpURL: \\cern.ch\dfs\Applications\Altium\Datasheets\R1210_VISHAY_CRCW1210.pdf; Author: CERN DEM JMW; CreateDate: 06.08.2014; LatestRevisionDate: 06.08.2014
R209 R214 = R0402_0R_JUMPER: Resistor; Part Description: 1A (0.05R Max DC Resistance) Zero Ohm Jumper; Manufacturer: GENERIC; Manufacturer1 Part Number: 232270591001L; PressFit: No; Part Number: R0402_0R_JUMPER; Component Kind: Standard; Component Type: Standard; Pin Count: 2; Value: 0; Status: Not Recommended; Manufacturer Part Number: R0402_0R_JUMPER; Case: 0402; Mounted: Yes; Sense: No; Socket: No; SMD: Yes; Manufacturer1 Example: YAGEO PHYCOMP; Manufacturer1 ComponentHeight: 0.4mm; HelpURL: \\cern.ch\dfs\Applications\Altium\Datasheets\R0402_Phycomp_RC0402.pdf; Author: CERN DEM JLC; CreateDate: 03.12.2007; LatestRevisionDate: 17.10.2012
SW5 = SW_OMRON_A6S-2102-H: 2 Ways SPST DIP Switch; Part Description: 2 Ways SPST DIP Switch, White Flat Actuator with Seal Tape, Contact Rating 25mA 24VDC; Manufacturer: OMRON; PressFit: No; Part Number: SW_OMRON_A6S-2102-H; Component Kind: Standard; Component Type: Standard; Pin Count: 4; PackageDescription: Pitch 2.54mm, Body 6.2x6.4mm, 2 Ways SPST Surface-Mounting DIP Switch, OMRON A6S-H; Family: Switch; Mounted: Yes; Socket: No; SMD: Yes; Sense: No; Status: None; Manufacturer Part Number: A6S-2102-H; ComponentHeight: 3.8mm; HelpURL: \\cern.ch\dfs\Applications\Altium\Datasheets\SW_OMRON_A6S-2102-H.pdf; Author: CERN DEM JMW; CreateDate: 25.09.2008; LatestRevisionDate: 25.09.2008
T19-T23 = BSS138LT1G: N-CHANNEL MOSFET WITH DIODE; Part Description: 50V 200mA N-Channel Enhancement Mode Field-Effect Transistor; Manufacturer: ON SEMICONDUCTOR; PressFit: No; Bonding: No; Part Number: BSS138LT1G; Component Kind: Standard; Component Type: Standard; Device: BSS138LT1G; PackageDescription: SOT23 3-Leads, Pitch 0.95mm - Body 1.4x3mm, IPC Medium Density; Manufacturer Part Number: BSS138LT1G; Pin Count: 3; Case: SOT23-3; Mounted: Yes; Socket: No; SMD: Yes; Sense: No; ComponentHeight: 1.11mm; HelpURL: \\cern.ch\dfs\Applications\Altium\Datasheets\BSS138LT1G.pdf; Author: CERN DEM JLC; CreateDate: 23.03.2009; LatestRevisionDate: 23.03.2009
TP1 = PLATED_HOLE1.0_PAD1.5: Single Terminal Socket; Part Description: Plated Through Hole: Hole Dia.=1mm Pad Dia.=1.5mm,  IPC-7251 Level C; Mounted: No; Part Number: PLATED_HOLE1.0_PAD1.5; Component Type: Standard (No BOM); Pin Count: 1; Family: Plated Hole; Socket: No; SMD: No; Sense: No; Status: None; ComponentHeight: 0mm; HelpURL: Undefined; Author: CERN DEM JLC; CreateDate: 30/10/2008; LatestRevisionDate: 30/10/2008; PackageDescription: Plated Through Hole: Hole Dia.=1mm Pad Dia.=1.5mm,  IPC-7251 Level C

## Sheet DIOT_SMA_EXT.schdoc: =DocumentName
size A3; EDA_Number: DIOT; Projet: KASLI 3U subsystem; ModifiedBy: -; CreateDate: XX/XX/XXXX; CheckedDate: -; Title2: v1.0; DivGrp: ISE; Designer: A.B.; DocumentNumber: 1; Revision: 0; SheetNumber: 17; SheetTotal: 17
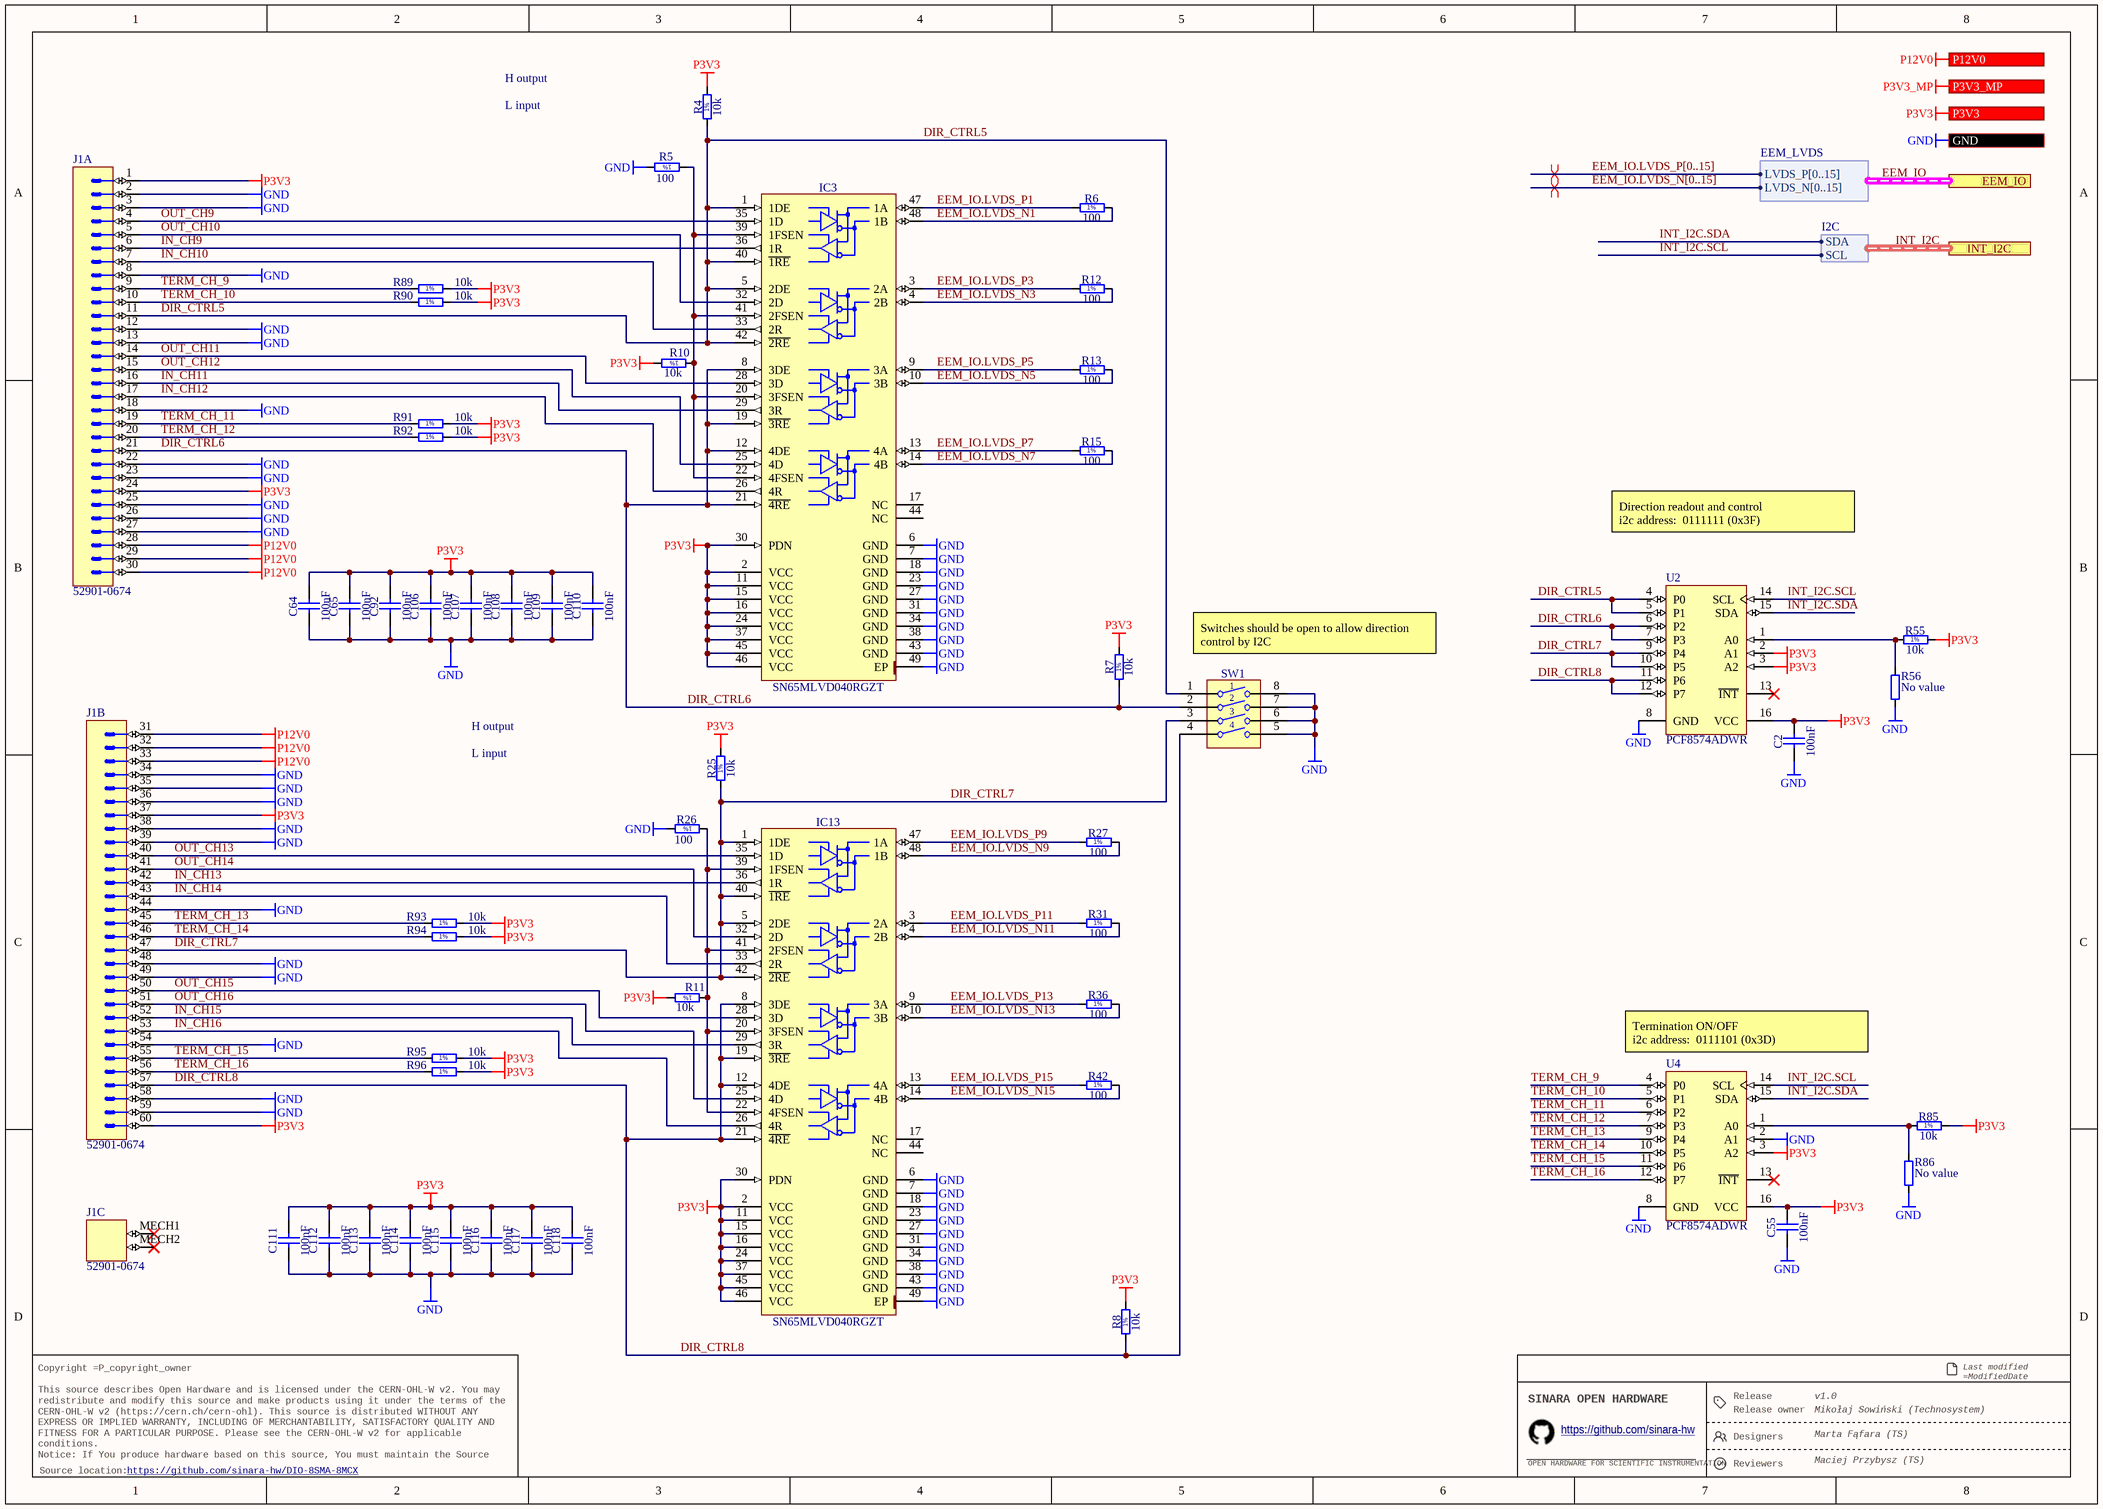
[diagram p16: DIOT_SMA_EXT.schdoc]

### Parts
C2  100nF  [CAPC1005X55N]
C55  100nF  [CAPC1005X55N]
C64  100nF  [CAPC1005X55N]
C65  100nF  [CAPC1005X55N]
C92  100nF  [CAPC1005X55N]
C106  100nF  [CAPC1005X55N]
C107  100nF  [CAPC1005X55N]
C108  100nF  [CAPC1005X55N]
C109  100nF  [CAPC1005X55N]
C110  100nF  [CAPC1005X55N]
C111  100nF  [CAPC1005X55N]
C112  100nF  [CAPC1005X55N]
C113  100nF  [CAPC1005X55N]
C114  100nF  [CAPC1005X55N]
C115  100nF  [CAPC1005X55N]
C116  100nF  [CAPC1005X55N]
C117  100nF  [CAPC1005X55N]
C118  100nF  [CAPC1005X55N]
IC3  SN65MLVD040RGZT  [QFN50P700X700X100-49N-S420]
IC13  SN65MLVD040RGZT  [QFN50P700X700X100-49N-S420]
J1  52901-0674  [FP-52901-0674-MFG]  (parts A,B,C of 3)
R4  10k  [RESC1005X40N]
R5  100  [RESC1005X40N]
R6  100  [RESC1005X40N]
R7  10k  [RESC1005X40N]
R8  10k  [RESC1005X40N]
R10  10k  [RESC1005X40N]
R11  10k  [RESC1005X40N]
R12  100  [RESC1005X40N]
R13  100  [RESC1005X40N]
R15  100  [RESC1005X40N]
R25  10k  [RESC1005X40N]
R26  100  [RESC1005X40N]
R27  100  [RESC1005X40N]
R31  100  [RESC1005X40N]
R36  100  [RESC1005X40N]
R42  100  [RESC1005X40N]
R55  10k  [RESC1005X40N]
R56  No value  [RESC1005X40N]
R85  10k  [RESC1005X40N]
R86  No value  [RESC1005X40N]
R89  10k  [RESC1005X40N]
R90  10k  [RESC1005X40N]
R91  10k  [RESC1005X40N]
R92  10k  [RESC1005X40N]
R93  10k  [RESC1005X40N]
R94  10k  [RESC1005X40N]
R95  10k  [RESC1005X40N]
R96  10k  [RESC1005X40N]
SW1  Switch  [SW_OMRON_A6S-4102-H]  (value not drawn)
U2  PCF8574ADWR  [DW0016A_M]
U4  PCF8574ADWR  [DW0016A_M]

### Ports
EEM_IO (harness EEM_LVDS), GND, INT_I2C (harness I2C), P3V3 (in), P3V3_MP (in), P12V0 (in)

### Harnesses
I2C: SDA, SCL
EEM_LVDS: LVDS_P[0..15], LVDS_N[0..15]

### Nets
GND: C2.1 C55.1 C64.1 C65.1 C92.1 C106.1 C107.1 C108.1 C109.1 C110.1 C111.1 C112.1 C113.1 C114.1 C115.1 C116.1 C117.1 C118.1 IC3.6(GND) IC3.7(GND) IC3.18(GND) IC3.23(GND) IC3.27(GND) IC3.31(GND) IC3.34(GND) IC3.38(GND) IC3.43(GND) IC3.49(EP) IC13.6(GND) IC13.7(GND) IC13.18(GND) IC13.23(GND) IC13.27(GND) IC13.31(GND) IC13.34(GND) IC13.38(GND) IC13.43(GND) IC13.49(EP) J1.2 J1.3 J1.8 J1.12 J1.13 J1.18 J1.22 J1.23 J1.25 J1.26 J1.27 J1.34 J1.35 J1.36 J1.38 J1.39 J1.44 J1.48 J1.49 J1.54 J1.58 J1.59 R5.2 R26.2 R56.1 R86.1 SW1.5 SW1.6 SW1.7 SW1.8 U2.8(GND) U4.2(A1) U4.8(GND) ; port GND
P3V3: C2.2 C55.2 C64.2 C65.2 C92.2 C106.2 C107.2 C108.2 C109.2 C110.2 C111.2 C112.2 C113.2 C114.2 C115.2 C116.2 C117.2 C118.2 IC3.2(VCC) IC3.11(VCC) IC3.15(VCC) IC3.16(VCC) IC3.24(VCC) IC3.30(PDN) IC3.37(VCC) IC3.45(VCC) IC3.46(VCC) IC13.2(VCC) IC13.11(VCC) IC13.15(VCC) IC13.16(VCC) IC13.24(VCC) IC13.30(PDN) IC13.37(VCC) IC13.45(VCC) IC13.46(VCC) J1.1 J1.24 J1.37 J1.60 R4.2 R7.2 R8.2 R10.2 R11.2 R25.2 R55.1 R85.1 R89.2 R90.2 R91.2 R92.2 R93.2 R94.2 R95.2 R96.2 U2.2(A1) U2.3(A2) U2.16(VCC) U4.3(A2) U4.16(VCC) ; port P3V3
P12V0: J1.28 J1.29 J1.30 J1.31 J1.32 J1.33 ; port P12V0
DIR_CTRL5: IC3.1(1DE) IC3.5(2DE) IC3.40(~{1RE}) IC3.42(~{2RE}) J1.11 R4.1 SW1.1 U2.4(P0) U2.5(P1)
DIR_CTRL6: IC3.8(3DE) IC3.12(4DE) IC3.19(~{3RE}) IC3.21(~{4RE}) J1.21 R7.1 SW1.2 U2.6(P2) U2.7(P3)
DIR_CTRL7: IC13.1(1DE) IC13.5(2DE) IC13.40(~{1RE}) IC13.42(~{2RE}) J1.47 R25.1 SW1.3 U2.9(P4) U2.10(P5)
DIR_CTRL8: IC13.8(3DE) IC13.12(4DE) IC13.19(~{3RE}) IC13.21(~{4RE}) J1.57 R8.1 SW1.4 U2.11(P6) U2.12(P7)
EEM_IO.LVDS_N1: IC3.48(1B) R6.2
EEM_IO.LVDS_N3: IC3.4(2B) R12.2
EEM_IO.LVDS_N5: IC3.10(3B) R13.2
EEM_IO.LVDS_N7: IC3.14(4B) R15.2
EEM_IO.LVDS_N9: IC13.48(1B) R27.2
EEM_IO.LVDS_N11: IC13.4(2B) R31.2
EEM_IO.LVDS_N13: IC13.10(3B) R36.2
EEM_IO.LVDS_N15: IC13.14(4B) R42.2
EEM_IO.LVDS_P1: IC3.47(1A) R6.1
EEM_IO.LVDS_P3: IC3.3(2A) R12.1
EEM_IO.LVDS_P5: IC3.9(3A) R13.1
EEM_IO.LVDS_P7: IC3.13(4A) R15.1
EEM_IO.LVDS_P9: IC13.47(1A) R27.1
EEM_IO.LVDS_P11: IC13.3(2A) R31.1
EEM_IO.LVDS_P13: IC13.9(3A) R36.1
EEM_IO.LVDS_P15: IC13.13(4A) R42.1
IN_CH9: IC3.36(1R) J1.6
IN_CH10: IC3.33(2R) J1.7
IN_CH11: IC3.29(3R) J1.16
IN_CH12: IC3.26(4R) J1.17
IN_CH13: IC13.36(1R) J1.42
IN_CH14: IC13.33(2R) J1.43
IN_CH15: IC13.29(3R) J1.52
IN_CH16: IC13.26(4R) J1.53
INT_I2C.SCL: U2.14(SCL) U4.14(SCL) ; port INT_I2C.SCL  [project net I2C_A.SCL]
INT_I2C.SDA: U2.15(SDA) U4.15(SDA) ; port INT_I2C.SDA  [project net I2C_A.SDA]
OUT_CH9: IC3.35(1D) J1.4
OUT_CH10: IC3.32(2D) J1.5
OUT_CH11: IC3.28(3D) J1.14
OUT_CH12: IC3.25(4D) J1.15
OUT_CH13: IC13.35(1D) J1.40
OUT_CH14: IC13.32(2D) J1.41
OUT_CH15: IC13.28(3D) J1.50
OUT_CH16: IC13.25(4D) J1.51
TERM_CH_9: J1.9 R89.1 U4.4(P0)
TERM_CH_10: J1.10 R90.1 U4.5(P1)
TERM_CH_11: J1.19 R91.1 U4.6(P2)
TERM_CH_12: J1.20 R92.1 U4.7(P3)
TERM_CH_13: J1.45 R93.1 U4.9(P4)
TERM_CH_14: J1.46 R94.1 U4.10(P5)
TERM_CH_15: J1.55 R95.1 U4.11(P6)
TERM_CH_16: J1.56 R96.1 U4.12(P7)
NetIC3_20: IC3.20(3FSEN) IC3.22(4FSEN) IC3.39(1FSEN) IC3.41(2FSEN) R5.1 R10.1
NetIC13_20: IC13.20(3FSEN) IC13.22(4FSEN) IC13.39(1FSEN) IC13.41(2FSEN) R11.1 R26.1
NetR55_2: R55.2 R56.2 U2.1(A0)
NetR85_2: R85.2 R86.2 U4.1(A0)

Not connected (* = marked no-connect by the designer): IC3 17(NC) 44(NC); IC13 17(NC) 44(NC); J1 MECH1* MECH2*; U2 13(~{INT})*; U4 13(~{INT})*

### Buses and harness runs
bus EEM_IO.LVDS_N[0..15]
bus EEM_IO.LVDS_P[0..15]
harness EEM_IO = port EEM_IO
harness INT_I2C = port INT_I2C

### Layout directives
differential pair; differential pair class Diff_100Ohm: (no net found under the mark)

### Notes on the sheet
- H output
- L input
- Direction readout and control
  i2c address:  0111111 (0x3F)
- (near SW1) Switches should be open to allow direction control by I2C
- (near U4) Termination ON/OFF
  i2c address:  0111101 (0x3D)
- Release
- Last modified =ModifiedDate
  Sheet =sheetnumber of =sheettotal · Size A3
- Copyright =P_copyright_owner
  This source describes Open Hardware and is licensed under the CERN-OHL-W v2. You may redistribute and modify this source and make products using it under the terms of the CERN-OHL-W v2 (https://cern.ch/cern-ohl). This source is distributed WITHOUT ANY EXPRESS OR IMPLIED WARRANTY, INCLUDING OF MERCHANTABILITY, SATISFACTORY QUALITY AND FITNESS FOR A PARTICULAR PURPOSE. Please see the CERN-OHL-W v2 for applicable conditions.
  Notice: If You produce hardware based on this source, You must maintain the Source Location visible on the product, its packaging or its documentation.
- SINARA OPEN HARDWARE
- OPEN HARDWARE FOR SCIENTIFIC INSTRUMENTATION
- https://github.com/sinara-hw
- Release owner
- Designers
- Reviewers
- Source location:
- (in symbol R0402_10K_1%_0.0625W_100PPM) 1%
- (in symbol R0402_100R_1%_0.1W_100PPM) 1%

### Library data of the parts
C2 C55 C64 C65 C92 C106-C118 = CC0402_100NF_50V_10%_X7R: as C3 on sheet DIOT_SMA_BASE_Split; Part Number: CC0402_100NF_50V_10%_X7R; Component Kind: Standard; Component Type: Standard; Pin Count: 2; Value: 100nF; Status: None; Manufacturer Part Number: CC0402_100NF_50V_10%_X7R; Case: 0402; Mounted: Yes; Socket: No; SMD: Yes; Sense: No; HelpURL: \\cern.ch\dfs\Applications\Altium\Datasheets\CC0402_MURATA_GRM155R71H104KE14D.pdf; Author: CERN DEM MR; CreateDate: 30.06.2017; LatestRevisionDate: 30.06.2017; Manufacturer1 Example: MURATA; Manufacturer1 ComponentHeight: 0.55mm
IC3 IC13 = SN65MLVD040RGZT: as IC32 on sheet DIOT_SMA_BASE_Split; Part Number: SN65MLVD040RGZT; Component Kind: Standard; Component Type: Standard; Device: SN65MLVD040RGZT; PackageDescription: QFN, 0.50mm Pitch, Square; 48 Pin, 7.00mm L X 7.00mm W X 1mm H body (W/Thermal Tab 4.2mm X 4.2mm), IPC Medium Density; Part Description: 4-Channel Half-Duplex M-LVDS Line Transceiver; Manufacturer Part Number: SN65MLVD040RGZT; Pin Count: 49; Case: QFN48; Mounted: Yes; Socket: No; SMD: Yes; Sense: No; ComponentHeight: 1mm; Author: CERN DEM JLC; HelpURL: \\cern.ch\dfs\Applications\Altium\Datasheets\SN65MLVD040RGZT.pdf; CreateDate: 17.03.2011; LatestRevisionDate: 17.03.2011
J1 = CMP-002-04665-1: Conn Board to Board RCP 60 POS 0.635mm Solder ST SMD Embossed T/R; Manufacturer: Molex; Gender: Receptacle; Mounting Technology: Surface Mount; Min Operating Temperature: -55°C; Manufacutrer Part Number: 52901-0674; Max Operating Temperature: 105°C; Pins: 60
R4 R7 R8 R10 R11 R25 R55 R85 R89-R96 = R0402_10K_1%_0.0625W_100PPM: as R3 on sheet DIOT_SMA_BASE_Split; Part Number: R0402_10K_1%_0.0625W_100PPM; Component Kind: Standard; Component Type: Standard; Pin Count: 2; Value: 10k; Status: Not recommended; Power: 0.0625W; Tolerance: ±1%; Manufacturer Part Number: R0402_10K_1%_0.0625W_100PPM; Case: 0402; Mounted: Yes; Sense: No; Socket: No; SMD: Yes; Manufacturer1 Example: YAGEO PHYCOMP; Manufacturer1 ComponentHeight: 0.4mm; HelpURL: \\cern.ch\dfs\Applications\Altium\Datasheets\R0402_Phycomp_RC0402.pdf; Author: CERN DEM JLC; CreateDate: 03.12.2007; LatestRevisionDate: 17.10.2012
R5 R6 R12 R13 R15 R26 R27 R31 R36 R42 = R0402_100R_1%_0.1W_100PPM: as R61 on sheet DIOT_SMA_BASE_Split; Part Number: R0402_100R_1%_0.1W_100PPM; Component Kind: Standard; Component Type: Standard; Pin Count: 2; Value: 100; Status: Not recommended; Tolerance: ±1%; Case: 0402; Mounted: Yes; Sense: No; Socket: No; SMD: Yes; Manufacturer1 Example: PANASONIC; Manufacturer1 ComponentHeight: 0.4mm; HelpURL: \\cern.ch\dfs\Applications\Altium\Datasheets\R0402_PANASONIC_ERJ2RK.pdf; Author: CERN DEM JLC; CreateDate: 12.12.2013; LatestRevisionDate: 03.03.2015
R56 R86 = R0402_0R_JUMPER: as R209 on sheet Iso_SMA_MCX_Channel; Part Number: R0402_0R_JUMPER; Component Kind: Standard; Component Type: Standard; Pin Count: 2; Value: No value; Status: Not Recommended; Manufacturer Part Number: R0402_0R_JUMPER; Case: 0402; Mounted: Yes; Sense: No; Socket: No; SMD: Yes; Manufacturer1 Example: YAGEO PHYCOMP; Manufacturer1 ComponentHeight: 0.4mm; HelpURL: \\cern.ch\dfs\Applications\Altium\Datasheets\R0402_Phycomp_RC0402.pdf; Author: CERN DEM JLC; CreateDate: 03.12.2007; LatestRevisionDate: 17.10.2012
SW1 = SW_OMRON_A6S-4102-H: as SW2 on sheet DIOT_SMA_BASE_Split; Part Number: SW_OMRON_A6S-4102-H; Component Kind: Standard; Component Type: Standard; Pin Count: 8; PackageDescription: Pitch 2.54mm, Body 11.3x6.4mm, 4 Ways SPST Surface-Mounting DIP Switch, OMRON A6S-H; Family: Switch; Mounted: Yes; Socket: No; SMD: Yes; Sense: No; Status: None; Manufacturer Part Number: A6S-4102-H; ComponentHeight: 3.8mm; HelpURL: \\cern.ch\dfs\Applications\Altium\Datasheets\SW_OMRON_A6S-4102-H.pdf; Author: CERN DEM JMW; CreateDate: 25.09.2008; LatestRevisionDate: 25.09.2008
U2 U4 = CMP-015-00013-1: as U1 on sheet DIOT_SMA_BASE_Split; Case/Package: SOIC; Manufacturer Part Number: PCF8574ADWR; Pins: 16; Min Operating Temperature: -40°C; Max Operating Temperature: 85°C